# Altium schematic sheet Power.SchDoc
size A4; SheetNumber: 2; SheetTotal: 4
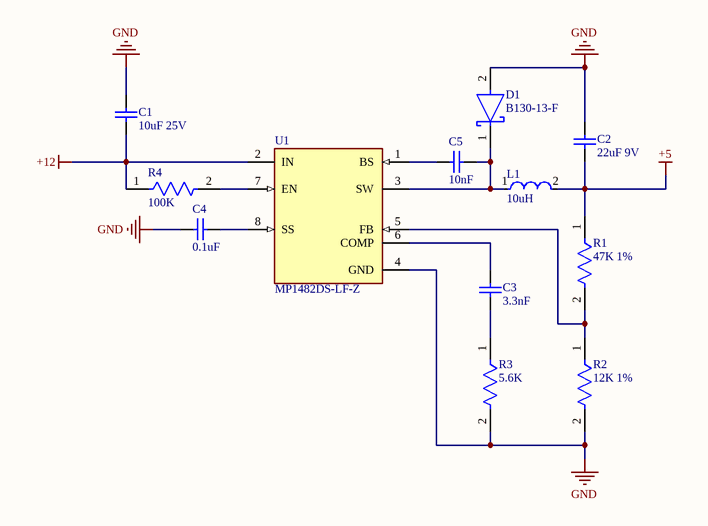
[diagram p0: Power.SchDoc]

## Parts
C1  10uF 25V  [CAPC1206(3216)100_L]
C2  22uF 9V  [CAPC1206(3216)100_L]
C3  3.3nF  [CAPC1206(3216)100_L]
C4  0.1uF  [CAPC1206(3216)100_L]
C5  10nF  [CAPC1206(3216)100_L]
D1  B130-13-F  [FP-SMA-MFG]
L1  10uH  [FP-IHLP-3232DZ-FP_2_413x5-MFG]
R1  47K 1%  [FP-CRGCQ1206-IPC_C]
R2  12K 1%  [FP-CRGCQ1206-IPC_C]
R3  5.6K  [FP-CRGCQ1206-IPC_C]
R4  100K  [FP-CRGCQ1206-IPC_C]
U1  MP1482DS-LF-Z  [FP-MP1482DS-LF-Z-MFG]

## Nets
+5: C2.1 L1.2 R1.1
+12: C1.1 R4.1 U1.2(IN)
GND: C1.2 C2.2 C4.2 D1.2(A) R2.2 R3.2 U1.4(GND)
NetC3_1: C3.1 R3.1
NetC3_2: C3.2 U1.6(COMP)
NetC4_1: C4.1 U1.8(SS)
NetC5_1: C5.1 D1.1(C) L1.1 U1.3(SW)
NetC5_2: C5.2 U1.1(BS)
NetR1_2: R1.2 R2.1 U1.5(FB)
NetR4_2: R4.2 U1.7(EN)

## Library data of the parts
C1-C5 = CMP-1037-03755-1: CAP 22nF 25V ±10% 1206 (3216 Metric) Thickness 1mm SMD; Tolerance: Â±10%; Case-Metric: 3216; Case-EIA: 1206; Value: 22nF; Max Thickness: 1 mm; Rated Voltage: 25 V; Technology: SMT
D1 = CMP-2000-05883-2: DIODE SCHOTTKY 30V 1A SMA; Max Forward Surge Current (Ifsm): 30A; Forward Voltage: 500mV; Polarity: Standard; Capacitance: 110pF; Element Configuration: Single; Peak Reverse Current: 500uA; Mount: Surface Mount; REACH SVHC: No SVHC; Output Current: 1A; Termination: SMD/SMT; Max Operating Temperature: 150°C; Height: 2.1mm; Voltage Rating (DC): 30V; Forward Current: 1A; Length: 4.6mm; Width: 2.92mm; Min Operating Temperature: -65°C; Number of Pins: 2; Current Rating: 1A; Packaging: Tape and Reel; Max Reverse Voltage (DC): 30V; Case/Package: SMA; Lead Free: Lead Free; Average Rectified Current: 1A; Radiation Hardening: No; Max Repetitive Reverse Voltage (Vrrm): 30V; Peak Non-Repetitive Surge Current: 30A; Weight: 0.002258oz; Package Quantity: 5000
L1 = CMP-02424-000031-1: Automotive Inductors, Low DCR Series 10uH 5.4A 51.8mΩ 20%
R1-R4 = CMP-03211-000249-1: CRGCQ1206 100KΩ 0.25W 1% ±100ppm/°C 200V; Manufacturer: TE Connectivity; Manufacturer Part Number: CRGCQ1206F100K; Tolerance: 0.01; Automotive Grade: Grade 1141; Lead Free: Yes; Power Rating: 0.25W; Resistance: 100KΩ; ComponentLink2Description: Datasheet; Voltage Rating: 200V; Ambient Temperature Range High: +70°C; Device Class L1: Passive Components; Value: 100KΩ; ComponentLink2URL: https://www.te.com/commerce/DocumentDelivery/DDEController?Action=showdoc&DocId=Data+Sheet%7F1773204-3%7F1%7Fpdf%7FEnglish%7FENG_DS_1773204-3_1.pdf%7F4-2176347-1150; Temperature Range High: +155°C; Category: Res; RoHS: TRUE; Temperature: -55°C to +155°C; Series: CRGCQ; Package: CRGCQ1206; Device Class L3: Chip SMD Resistors; Height: 0.65mm; Automotive: Yes; Temperature Coefficient: ±100ppm/°C; Temperature Range Low: -55°C; Ipc Land Pattern Name: RESC310155X55; Device Class L2: Resistors; Octopart: https://octopart.com/crgcq1206f100k-te+connectivity-91018242; Composition: Thick Film
U1 = CMP-57379-000001-1: IC REG BUCK ADJUSTABLE 2A 8SOIC; Manufacturer: Monolithic Power Systems; Max Duty Cycle: 90%; Switching Frequency: 340kHz; Standoff Height: 0.1mm; Max Power Dissipation: 1.38W; Output Type: AdjustableProgrammable; Output Voltage: 0.923-15V; Nominal Supply Current: 1.3mA; Max Supply Voltage: 18V; Max Junction Temp: +125°C; Description: Buck Switching Regulator IC Positive Adjustable 0.923V 1 Output 2A 8-SOIC (0.154", 3.90mm Width); Number Of Outputs: 1; Min Supply Voltage: 4.75V; Switching Topology: Buck; Ambient Temperature Range High: +85°C; Temperature: -40°C to +125°C; Device Class L2: Power Management ICs; Mouser Description: MP1482 Series 18 V 2 A SMT Synchronous Rectified Step-Down Converter-SOIC-8; Device Class L3: Voltage Regulators - Switching; Ipc Land Pattern Name: SOIC127P600X155-8; Automotive: No; Octopart: https://octopart.com/mp1482ds-lf-z-monolithic+power+systems-17392490; ComponentLink2Description: Datasheet; RoHS: TRUE; Height: 1.75mm; Digikey Description: IC REG BUCK ADJUSTABLE 2A 8SOIC; Lead Free: Yes; Device Class L1: Integrated Circuits (ICs); Temperature Range Low: -40°C; Category: IC; Manufacturer Part Number: MP1482DS-LF-Z; Package: 0; Output Current: 2A; ComponentLink2URL: https://www.monolithicpower.com/en/documentview/productdocument/index/version/2/document_type/Datasheet/lang/en/sku/MP1482/document_id/344/; Temperature Range High: +125°C; Ambient Temperature Range Low: -40°C